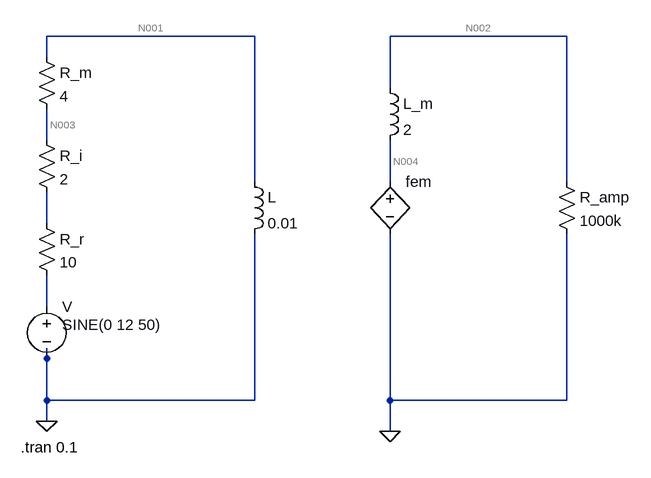
[diagram p0: schematic Draft2.asc]
Draft2.asc, the LTspice schematic file:
Version 4.1
SHEET 1 952 680
WIRE 368 -288 48 -288
WIRE 848 -288 576 -288
WIRE 48 -256 48 -288
WIRE 576 -208 576 -288
WIRE 48 -128 48 -176
WIRE 368 -64 368 -288
WIRE 576 -64 576 -128
WIRE 848 -64 848 -288
WIRE 48 0 48 -48
WIRE 48 128 48 80
WIRE 48 208 48 192
WIRE 48 272 48 208
WIRE 368 272 368 16
WIRE 368 272 48 272
WIRE 576 272 576 16
WIRE 848 272 848 16
WIRE 848 272 576 272
WIRE 48 304 48 272
WIRE 576 320 576 272
FLAG 48 304 0
FLAG 576 320 0
SYMBOL voltage 48 112 R0
WINDOW 3 24 44 Left 2
WINDOW 123 0 0 Left 0
WINDOW 39 0 0 Left 0
SYMATTR InstName V
SYMATTR Value SINE(0 12 50)
SYMBOL res 32 -16 R0
SYMATTR InstName R_r
SYMATTR Value 10
SYMBOL res 32 -144 R0
SYMATTR InstName R_i
SYMATTR Value 2
SYMBOL res 32 -272 R0
SYMATTR InstName R_m
SYMATTR Value 4
SYMBOL ind 352 -80 R0
SYMATTR InstName L
SYMATTR Value 0.01
SYMBOL bv 576 -80 R0
WINDOW 3 24 96 Invisible 2
SYMATTR InstName fem
SYMATTR Value V = 0.005 * ddt(I(L))
SYMBOL ind 560 -224 R0
SYMATTR InstName L_m
SYMATTR Value 2
SYMBOL res 832 -80 R0
SYMATTR InstName R_amp
SYMATTR Value 1000k
TEXT 8 344 Left 2 !.tran 0.1

The netlist it stands for:
* Draft2.asc
V N006 0 SINE(0 12 50)
R_r N005 N006 10
R_i N003 N005 2
R_m N001 N003 4
L N001 0 0.01
B§fem N004 0 V = 0.005 * ddt(I(L))
L_m N002 N004 2
R_amp N002 0 1000k
.tran 0.1
.backanno
.end

* Results of the author's LTspice run, read from the files saved beside the schematic
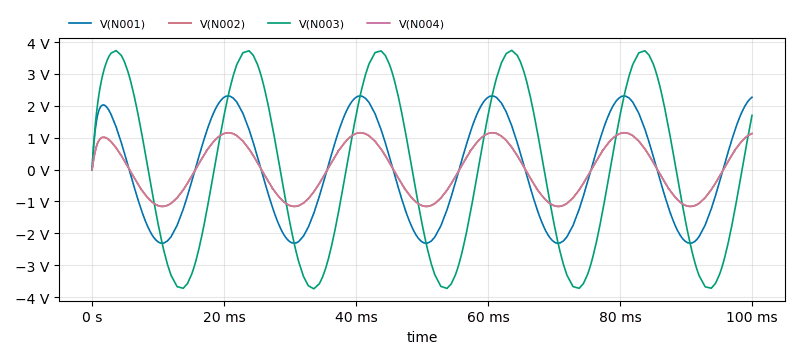
[diagram p1: Transient Analysis of Draft2.asc, plotted from the saved traces]
* Transient Analysis, 1 run:
*   V(N001): min -2.312 V, max 2.312 V, average -14.03 mV, rms 1.62 V, last 2.269 V
*   V(N002): min -1.156 V, max 1.156 V, average -7.463 mV, rms 809.9 mV, last 1.13 V
*   V(N003): min -3.741 V, max 3.742 V, average -10.39 mV, rms 2.633 V, last 1.702 V
*   V(N004): min -1.156 V, max 1.156 V, average -7.451 mV, rms 809.9 mV, last 1.131 V